# Altium schematic sheet door_sch.SchDoc
size A; SheetNumber: 1; SheetTotal: 1
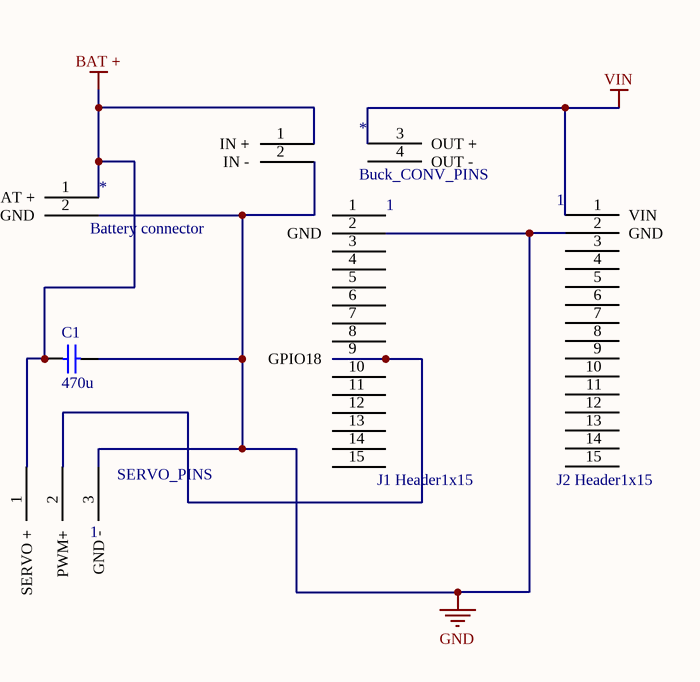
[diagram p0: door_sch.SchDoc]

## Parts
(Parts that share a designator on the sheet are numbered #1, #2 ... from top to bottom, then left to right.)
1#1  J1 Header1x15  [SOCKET_1x15_P2.54]
1#2  J2 Header1x15  [SOCKET_1x15_P2.54]
1#3  SERVO_PINS  [SERVO_1X3_CONNECTOR]
*#1  Buck_CONV_PINS  [BUCK_1X4_CONNECTOR]
*#2  Battery connector  [BAT_1x2_CONNECTOR]
C1  value 470u  [CAPCITOR_1X2]  (hidden comment: Capacitor)

## Nets
BAT +: 1#3.1(SERVO_+) *#1.1(IN_+) *#2.1(BAT_+) C1.1
GND: 1#1.2(GND) 1#2.2(GND) 1#3.3(GND_-) *#1.2(IN_-) *#2.2(GND) C1.2
VIN: 1#2.1(VIN) *#1.3(OUT_+)
Net1#1_9: 1#1.9(GPIO18) 1#3.2(PWM+)

Not connected (* = marked no-connect by the designer): 1#1 1 3 4 5 6 7 8 10 11 12 13 14 15; 1#2 3 4 5 6 7 8 9 10 11 12 13 14 15; *#1 4(OUT_-)

## Library data of the parts
1#1 1#2 = Header1x15: 1x15 connector for ESP32 dev board
C1 = Capacitor: SimulationGenericComponent: True